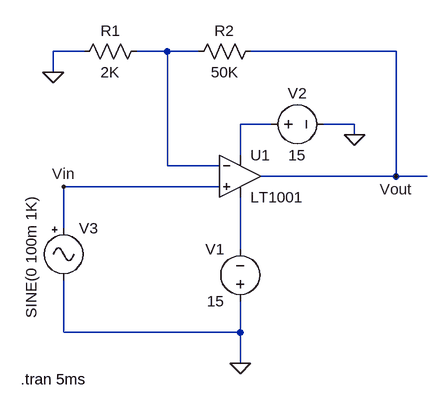
[diagram p0: schematic EX4.2.asc]
EX4.2.asc, the LTspice schematic file:
Version 4
SHEET 1 896 680
WIRE -48 48 -96 48
WIRE 80 48 32 48
WIRE 128 48 80 48
WIRE 432 48 208 48
WIRE -96 80 -96 48
WIRE 240 160 192 160
WIRE 368 160 320 160
WIRE 368 176 368 160
WIRE 192 208 192 160
WIRE 80 224 80 48
WIRE 160 224 80 224
WIRE 432 240 432 48
WIRE 432 240 224 240
WIRE 480 240 432 240
WIRE 160 256 -80 256
WIRE -80 320 -80 256
WIRE 192 352 192 272
WIRE -80 480 -80 400
WIRE 192 480 192 432
WIRE 192 480 -80 480
WIRE 192 528 192 480
FLAG 192 528 0
FLAG 368 176 0
FLAG 432 240 Vout
FLAG -96 80 0
FLAG -80 256 Vin
SYMBOL voltage 192 448 R180
WINDOW 0 24 96 Left 2
WINDOW 3 24 16 Left 2
SYMATTR InstName V1
SYMATTR Value 15
SYMBOL opamps\\LT1001 192 176 R0
SYMATTR InstName U1
SYMBOL voltage 224 160 R270
WINDOW 0 32 56 VTop 2
WINDOW 3 -32 56 VBottom 2
SYMATTR InstName V2
SYMATTR Value 15
SYMBOL res 224 32 R90
WINDOW 0 0 56 VBottom 2
WINDOW 3 32 56 VTop 2
SYMATTR InstName R2
SYMATTR Value 50K
SYMBOL res 48 32 R90
WINDOW 0 0 56 VBottom 2
WINDOW 3 32 56 VTop 2
SYMATTR InstName R1
SYMATTR Value 2K
SYMBOL Misc\\signal -80 304 R0
WINDOW 3 -50 155 VLeft 2
SYMATTR InstName V3
SYMATTR Value SINE(0 100m 1K)
TEXT -146 552 Left 2 !.tran 5ms

The netlist it stands for:
* EX4.2.asc
V1 0 N003 15
XU1 Vin N001 N002 N003 Vout LT1001  ; pins In+ In- V+ V- OUT
V2 N002 0 15
R2 Vout N001 50K
R1 N001 0 2K
V3 Vin 0 SINE(0 100m 1K)
.tran 5ms
.lib LTC.lib
.backanno
.end